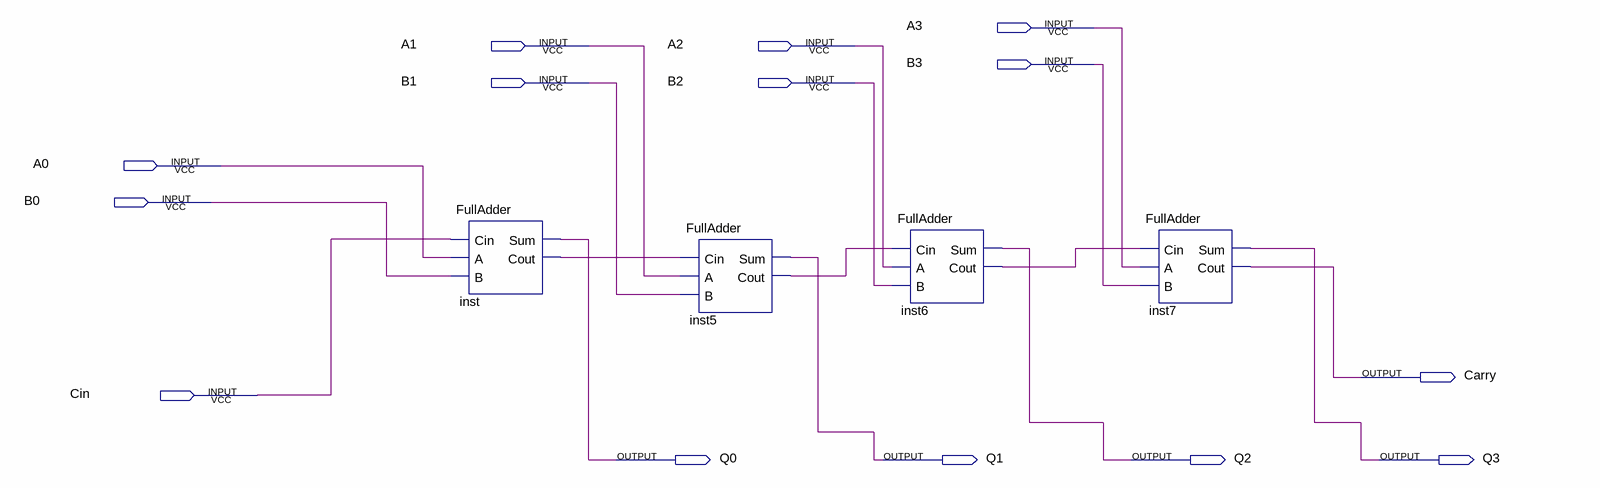
[diagram p0: schematic sheet]
// Quartus schematic FA4bit.bdf as structural Verilog: 4 symbols, 14 pins
module FA4bit (
  input  A3,
  input  A1,
  input  A2,
  input  B3,
  input  B1,
  input  B2,
  input  A0,
  input  B0,
  input  Cin,
  output Carry,
  output Q0,
  output Q1,
  output Q2,
  output Q3
);

  wire inst5_cout, inst6_cout, inst_cout;

  FullAdder inst (.Cin(Cin), .A(A0), .B(B0), .Sum(Q0), .Cout(inst_cout));
  FullAdder inst5 (.Cin(inst_cout), .A(A1), .B(B1), .Sum(Q1), .Cout(inst5_cout));
  FullAdder inst6 (.Cin(inst5_cout), .A(A2), .B(B2), .Sum(Q2), .Cout(inst6_cout));
  FullAdder inst7 (.Cin(inst6_cout), .A(A3), .B(B3), .Sum(Q3), .Cout(Carry));
endmodule
